# Altium project Task_Tony.PrjPcb (part 8 of 8)
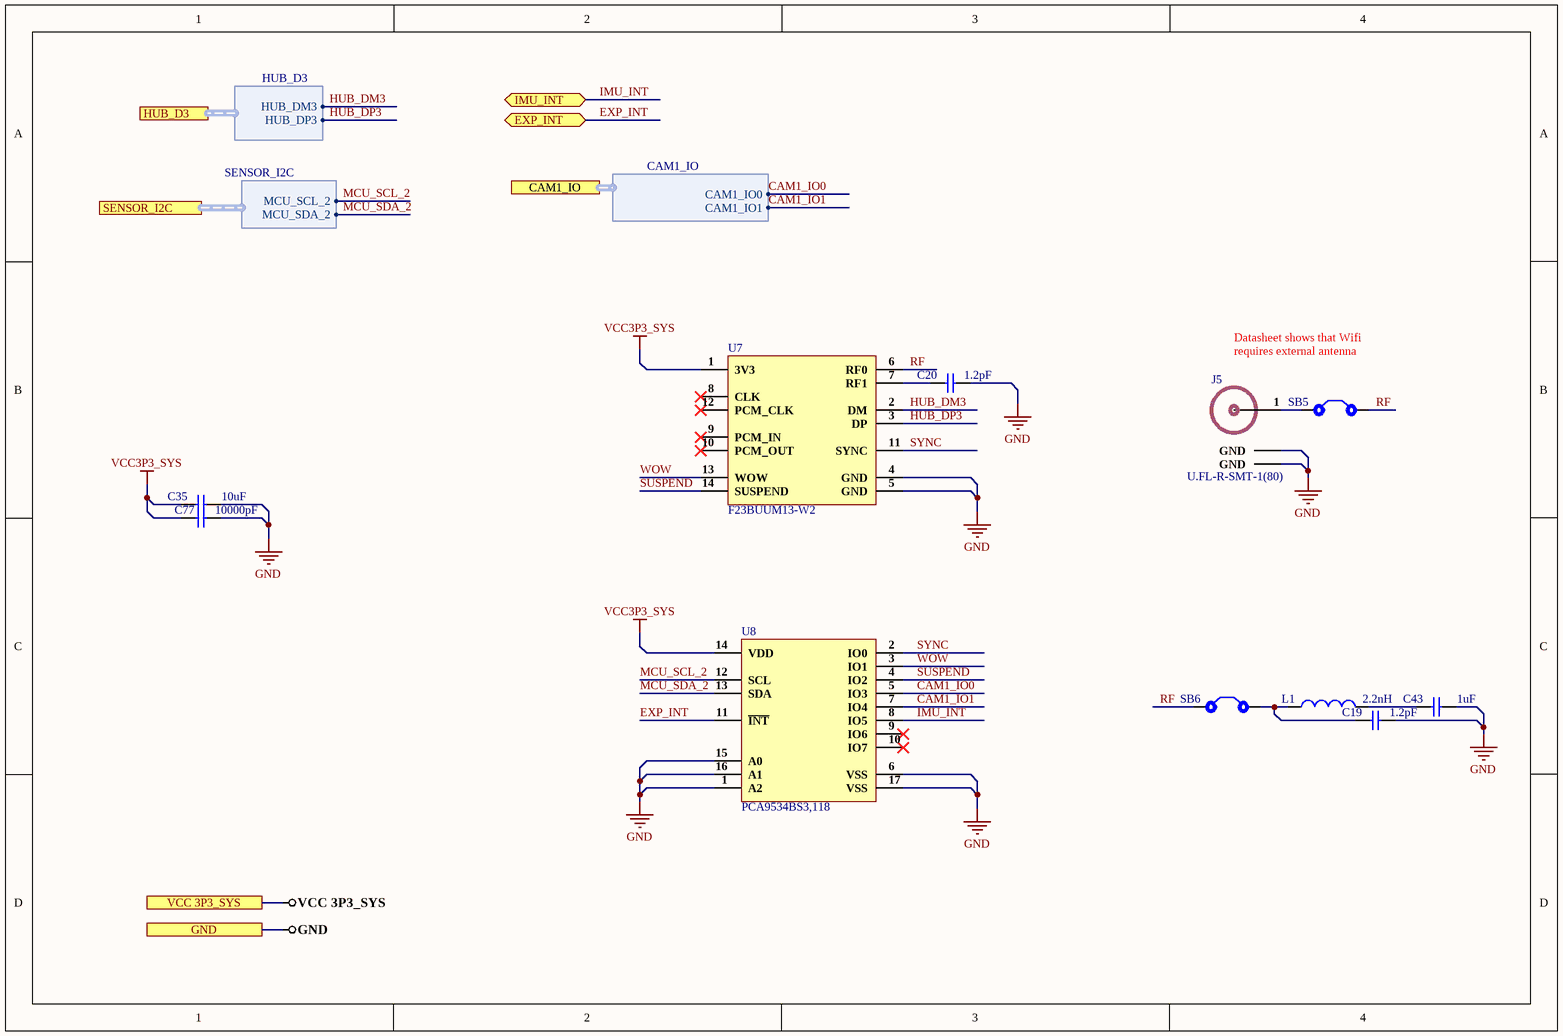
[diagram p31: BLE&WiFi_Section.SchDoc]

## Nets that join several sheets
CAM_1.8V: Main_Cont (U4.59), Camera_Section (C31.1 C32.1 J3.11 R24.2)
CAM_2.8V: Main_Cont (U4.58), Camera_Section (C29.1 C30.1 J3.4)
DC5V_OTG: Main_Cont (U4.17), USB_OTG (C58.1 C59.1 J21.1 U9.1)
GND: Main_Cont (7 pins), USB_Power (7 pins), MCU_Core_Power (8 pins), RTC_Sec (C13.2 C66.2 J26.2 U2.2), MIC_Sec (C1.2 C2.2 R3.2), Audio_Codec_Sec (15 pins), Headphones_Sec (J2.1), Sensor_Section (12 pins), Key_Buttons (8 pins), USB_OTG (7 pins), USB_Host (19 pins), Camera_Section (19 pins), Memory_Section (7 pins), 7''_LCD_Connector (10 pins), LCD_Drive_Sec (16 pins), Connector_Section (19 pins), USIM_Sec (20 pins), 3G_Modem (57 pins), Level_Shifter_Sec (C41.2 C76.2 U11.2), RS-232 Tranceiver Section (7 pins), BLE&WiFi_Section (14 pins)
LCD_AVDD: 7''_LCD_Connector (J10.43), LCD_Drive_Sec (Q8.3)
LVDS_VDD: USB_Power (5 pins), Audio_Codec_Sec (C5.1 C6.1 U1.26), RS-232 Tranceiver Section (J18.1)
VBAT: Main_Cont (U4.49 U4.50), Connector_Section (5 pins), USIM_Sec (14 pins), 3G_Modem (LED1.1 LED2.1)
VBAT_SYS: Main_Cont (U4.53 U4.54), USB_Power (C40.2 Q6.2 R133.2), MCU_Core_Power (C84.1 C85.1 U13.8), RTC_Sec (D1.1)
VBAT_USB: USB_Power (C90.1 C91.1 D12.1 R129.1), USB_OTG (C57.1 U9.5), USB_Host (7 pins)
VCC1P0_CORE_DC: Main_Cont (U4.47 U4.48), MCU_Core_Power (6 pins)
VCC 1P8_LDO: Sensor_Section (5 pins), Level_Shifter_Sec (C76.1 U11.3)
VCC 1P8_RTC: Main_Cont (U4.169), RTC_Sec (C66.1 U2.3)
VCC 3P3_SYS: Main_Cont (C28.1 LED4.1 U4.1), Main_Cont_2 (LED5.1), USB_Power (R131.2), Audio_Codec_Sec (5 pins), Headphones_Sec (R8.2), Sensor_Section (R38.2 R39.2 R40.2), Key_Buttons (R31.2 R33.2), Camera_Section (J4.22), Memory_Section (7 pins), 7''_LCD_Connector (11 pins), LCD_Drive_Sec (8 pins), Level_Shifter_Sec (C41.1 U11.1), RS-232 Tranceiver Section (C52.1 J16.1 U12.19 U12.20), BLE&WiFi_Section (C35.1 C77.1 U7.1 U8.14)
VGH: 7''_LCD_Connector (J10.41), LCD_Drive_Sec (U15.4)
VGL: 7''_LCD_Connector (J10.42), LCD_Drive_Sec (C73.1 L2.2 R22.2)
VLED_N: 7''_LCD_Connector (J10.3), LCD_Drive_Sec (U15.17)
VLED_N2: 7''_LCD_Connector (J10.4), LCD_Drive_Sec (U15.18)
VLED_P: 7''_LCD_Connector (J10.1 J10.2), LCD_Drive_Sec (C72.1 U15.16)
VUSB_GSM: USB_Host (J22.1), USIM_Sec (U3.71)
3G_MOD.GPIOA28: Main_Cont (U4.166), 3G_Modem (R19.2)
3G_MOD.GPIOB8: Main_Cont (U4.163), 3G_Modem (R17.2)
3G_MOD.GPIOB9: Main_Cont (U4.164), 3G_Modem (R18.2)
3G_MOD.GPIOC7: Main_Cont (U4.162), 3G_Modem (R16.2)
CAM1_IO.CAM1_IO0: Camera_Section (J4.17), BLE&WiFi_Section (U8.5)
CAM1_IO.CAM1_IO1: Camera_Section (J4.18), BLE&WiFi_Section (U8.7)
CAM_CLK: Main_Cont_3 (U4.130), Camera_Section (J3.17)
CAM_D0: Main_Cont_3 (U4.131), Camera_Section (J3.19)
CAM_D1: Main_Cont_3 (U4.132), Camera_Section (J3.21)
CAM_D2: Main_Cont_3 (U4.133), Camera_Section (J3.22)
CAM_D3: Main_Cont_3 (U4.134), Camera_Section (J3.20)
CAM_D4: Main_Cont_3 (U4.135), Camera_Section (J3.18)
CAM_D5: Main_Cont_3 (U4.136), Camera_Section (J3.16)
CAM_D6: Main_Cont_3 (U4.137), Camera_Section (J3.14)
CAM_D7: Main_Cont_3 (U4.138), Camera_Section (J3.12)
CAM_H: Main_Cont_3 (U4.128), Camera_Section (J3.9)
CAM_PD: Main_Cont_3 (U4.139), Camera_Section (J3.8)
CAM_PN: Main_Cont_3 (U4.141), Camera_Section (J3.24 R27.2)
CAM_RST: Main_Cont_3 (U4.140), Camera_Section (J3.6)
CAM_SIG.CAM_V: Main_Cont_3 (U4.129), Camera_Section (J3.7)
EXP_INT: Main_Cont (U4.165), BLE&WiFi_Section (U8.11)
GSM_DM: USB_Host (SB16.1 U10.27), USIM_Sec (U3.70)
GSM_DP: USB_Host (SB17.1 U10.28), USIM_Sec (U3.69)
HP_OUT_L: Audio_Codec_Sec (U1.30), Headphones_Sec (C11.1)
HP_OUT_R: Audio_Codec_Sec (U1.29), Headphones_Sec (C12.1)
HUB_D3.HUB_DM3: USB_Host (U10.8), BLE&WiFi_Section (U7.2)
HUB_D3.HUB_DP3: USB_Host (U10.9), BLE&WiFi_Section (U7.3)
IMU_INT: Sensor_Section (U5.12), BLE&WiFi_Section (U8.8)
LCD_B0: Main_Cont_3 (U4.35), 7''_LCD_Connector (J10.19 R69.1)
LCD_B1: Main_Cont_3 (U4.36), 7''_LCD_Connector (J10.18 R71.1)
LCD_B2: Main_Cont_3 (U4.37), 7''_LCD_Connector (J10.17 R72.1)
LCD_B3: Main_Cont_3 (U4.38), 7''_LCD_Connector (J10.16 R10.1)
LCD_B4: Main_Cont_3 (U4.39), 7''_LCD_Connector (J10.15 R12.1)
LCD_B5: Main_Cont_3 (U4.40), 7''_LCD_Connector (J10.14 R20.1)
LCD_B6: Main_Cont_3 (U4.41), 7''_LCD_Connector (J10.13 R73.1)
LCD_B7: Main_Cont_3 (U4.42), 7''_LCD_Connector (J10.12 R68.1)
LCD_CLK: Main_Cont (U4.46), 7''_LCD_Connector (J10.37)
LCD_DE: Main_Cont_3 (U4.43), 7''_LCD_Connector (J10.9)
LCD_G0: Main_Cont_3 (U4.27), 7''_LCD_Connector (J10.27)
LCD_G1: Main_Cont_3 (U4.28), 7''_LCD_Connector (J10.26)
LCD_G2: Main_Cont_3 (U4.29), 7''_LCD_Connector (J10.25)
LCD_G3: Main_Cont_3 (U4.30), 7''_LCD_Connector (J10.24)
LCD_G4: Main_Cont_3 (U4.31), 7''_LCD_Connector (J10.23)
LCD_G5: Main_Cont_3 (U4.32), 7''_LCD_Connector (J10.22)
LCD_G6: Main_Cont_3 (U4.33), 7''_LCD_Connector (J10.21)
LCD_G7: Main_Cont_3 (U4.34), 7''_LCD_Connector (J10.20)
LCD_HSYNC: Main_Cont (U4.44), 7''_LCD_Connector (J10.11)
LCD_R0: Main_Cont_3 (U4.19), 7''_LCD_Connector (J10.35)
LCD_R1: Main_Cont_3 (U4.20), 7''_LCD_Connector (J10.34)
LCD_R2: Main_Cont_3 (U4.21), 7''_LCD_Connector (J10.33)
LCD_R3: Main_Cont_3 (U4.22), 7''_LCD_Connector (J10.32)
LCD_R4: Main_Cont_3 (U4.23), 7''_LCD_Connector (J10.31)
LCD_R5: Main_Cont_3 (U4.24), 7''_LCD_Connector (J10.30)
LCD_R6: Main_Cont_3 (U4.25), 7''_LCD_Connector (J10.29)
LCD_R7: Main_Cont_3 (U4.26), 7''_LCD_Connector (J10.28)
LCD_SIG.LCD_VSYNC: Main_Cont (U4.45), 7''_LCD_Connector (J10.10)
MCU_CAM1_MCLK: Main_Cont_2 (U4.142), Camera_Section (J3.13)
MCU_HP_DET: Main_Cont_2 (U4.127), Headphones_Sec (R9.2)
MCU_I2C.MCU_SCL_0: Main_Cont_2 (U4.78), Audio_Codec_Sec (R4.1), Camera_Section (J4.20 R25.2)
MCU_I2C.MCU_SDA_0: Main_Cont_2 (U4.79), Audio_Codec_Sec (R5.1), Camera_Section (J4.21 R26.2)
MCU_I2S.MCU_I2S_BCK: Main_Cont_2 (U4.123), Audio_Codec_Sec (U1.8)
MCU_I2S.MCU_I2S_LRCK: Main_Cont_2 (U4.126), Audio_Codec_Sec (U1.7)
MCU_I2S.MCU_I2S_MCLK: Main_Cont_2 (U4.122), Audio_Codec_Sec (U1.11)
MCU_I2S.MCU_I2S_SDIN: Main_Cont_2 (U4.124), Audio_Codec_Sec (U1.9)
MCU_I2S.MCU_I2S_SDOUT: Main_Cont_2 (U4.125), Audio_Codec_Sec (U1.10)
MCU_KEY.MCU_KEY_VOLDN: Main_Cont_2 (U4.156), Key_Buttons (R34.2)
MCU_KEY.MCU_KEY_VOLUP: Main_Cont_2 (U4.157), Key_Buttons (R32.2)
MCU_KEY.MCU_PWR_KEY: Main_Cont_2 (U4.160), Key_Buttons (C34.2 R35.2)
MCU_KEY.MCU_RESETIN: Main_Cont_2 (U4.159), Key_Buttons (R30.2)
MCU_OTG_PWRON: Main_Cont_2 (U4.14), USB_OTG (R58.2)
MCU_PWREN_SYS: Main_Cont_2 (U4.57), MCU_Core_Power (U13.1)
MCU_SCL_2: Main_Cont_2 (U4.7), Sensor_Section (R40.1 U5.23 U6.5), BLE&WiFi_Section (U8.12)
MCU_SD0.MCU_SD0_CD: Main_Cont_2 (U4.177), Memory_Section (J9.*CD Switch)
MCU_SD0.MCU_SD0_CLK: Main_Cont_2 (U4.183), Memory_Section (R56.1)
MCU_SD0.MCU_SD0_CMD: Main_Cont_2 (U4.182), Memory_Section (J9.3)
MCU_SD0.MCU_SD0_D0: Main_Cont_2 (U4.181), Memory_Section (J9.7 R61.8)
MCU_SD0.MCU_SD0_D1: Main_Cont_2 (U4.180), Memory_Section (J9.8 R61.7)
MCU_SD0.MCU_SD0_D2: Main_Cont_2 (U4.179), Memory_Section (J9.1 R61.6)
MCU_SD0.MCU_SD0_D3: Main_Cont_2 (U4.178), Memory_Section (J9.2 R61.5)
MCU_SDA_2: Main_Cont_2 (U4.6), Sensor_Section (R38.1 U5.24 U6.2), BLE&WiFi_Section (U8.13)
MCU_USB+: Main_Cont_2 (U4.16), USB_OTG (J21.3)
MCU_USB-: Main_Cont_2 (U4.15 U4.18), USB_OTG (J21.2 J21.4)
MCU_USB_HOST.MCU_USB_HOST_D+: Main_Cont_2 (U4.13), USB_Host (U10.26)
MCU_USB_HOST.MCU_USB_HOST_D-: Main_Cont_2 (U4.12), USB_Host (U10.25)
MIC1N: MIC_Sec (MK1.2 R3.1), Audio_Codec_Sec (U1.2)
MIC1P: MIC_Sec (C2.1 MK1.1 R1.1), Audio_Codec_Sec (U1.1)
MICBIAS: MIC_Sec (R2.1), Audio_Codec_Sec (U1.32)
MIPICSI.MIPICSI_DN0: Main_Cont_3 (U4.118), Camera_Section (J4.2)
MIPICSI.MIPICSI_DN1: Main_Cont_3 (U4.116), Camera_Section (J4.5)
MIPICSI.MIPICSI_DN2: Main_Cont_3 (U4.114), Camera_Section (J4.11)
MIPICSI.MIPICSI_DN3: Main_Cont_3 (U4.112), Camera_Section (J4.14)
MIPICSI.MIPICSI_DNCLK: Main_Cont_3 (U4.120), Camera_Section (J4.8)
MIPICSI.MIPICSI_DP0: Main_Cont_3 (U4.119), Camera_Section (J4.3)
MIPICSI.MIPICSI_DP1: Main_Cont_3 (U4.117), Camera_Section (J4.6)
MIPICSI.MIPICSI_DP2: Main_Cont_3 (U4.115), Camera_Section (J4.12)
MIPICSI.MIPICSI_DP3: Main_Cont_3 (U4.113), Camera_Section (J4.15)
MIPICSI.MIPICSI_DPCLK: Main_Cont_3 (U4.121), Camera_Section (J4.9)
PWRKEY: USIM_Sec (U3.21), 3G_Modem (Q7.3)
RESET_N: USIM_Sec (U3.20), 3G_Modem (Q4.3)
UART_SIG.UARTRXD0: Main_Cont (U4.149), RS-232 Tranceiver Section (U12.10)
UART_SIG.UARTRXD1: Main_Cont (U4.147), RS-232 Tranceiver Section (U12.15)
UART_SIG.UARTRXD3: Main_Cont (U4.143), RS-232 Tranceiver Section (J16.2)
UART_SIG.UARTTXD0: Main_Cont (U4.150), RS-232 Tranceiver Section (U12.12)
UART_SIG.UARTTXD1: Main_Cont (U4.148), RS-232 Tranceiver Section (U12.13)
UART_SIG.UARTTXD3: Main_Cont (U4.144), RS-232 Tranceiver Section (J17.1)